# Altium project Audio_Meter_V3.2.PrjPcb (part 6 of 6)
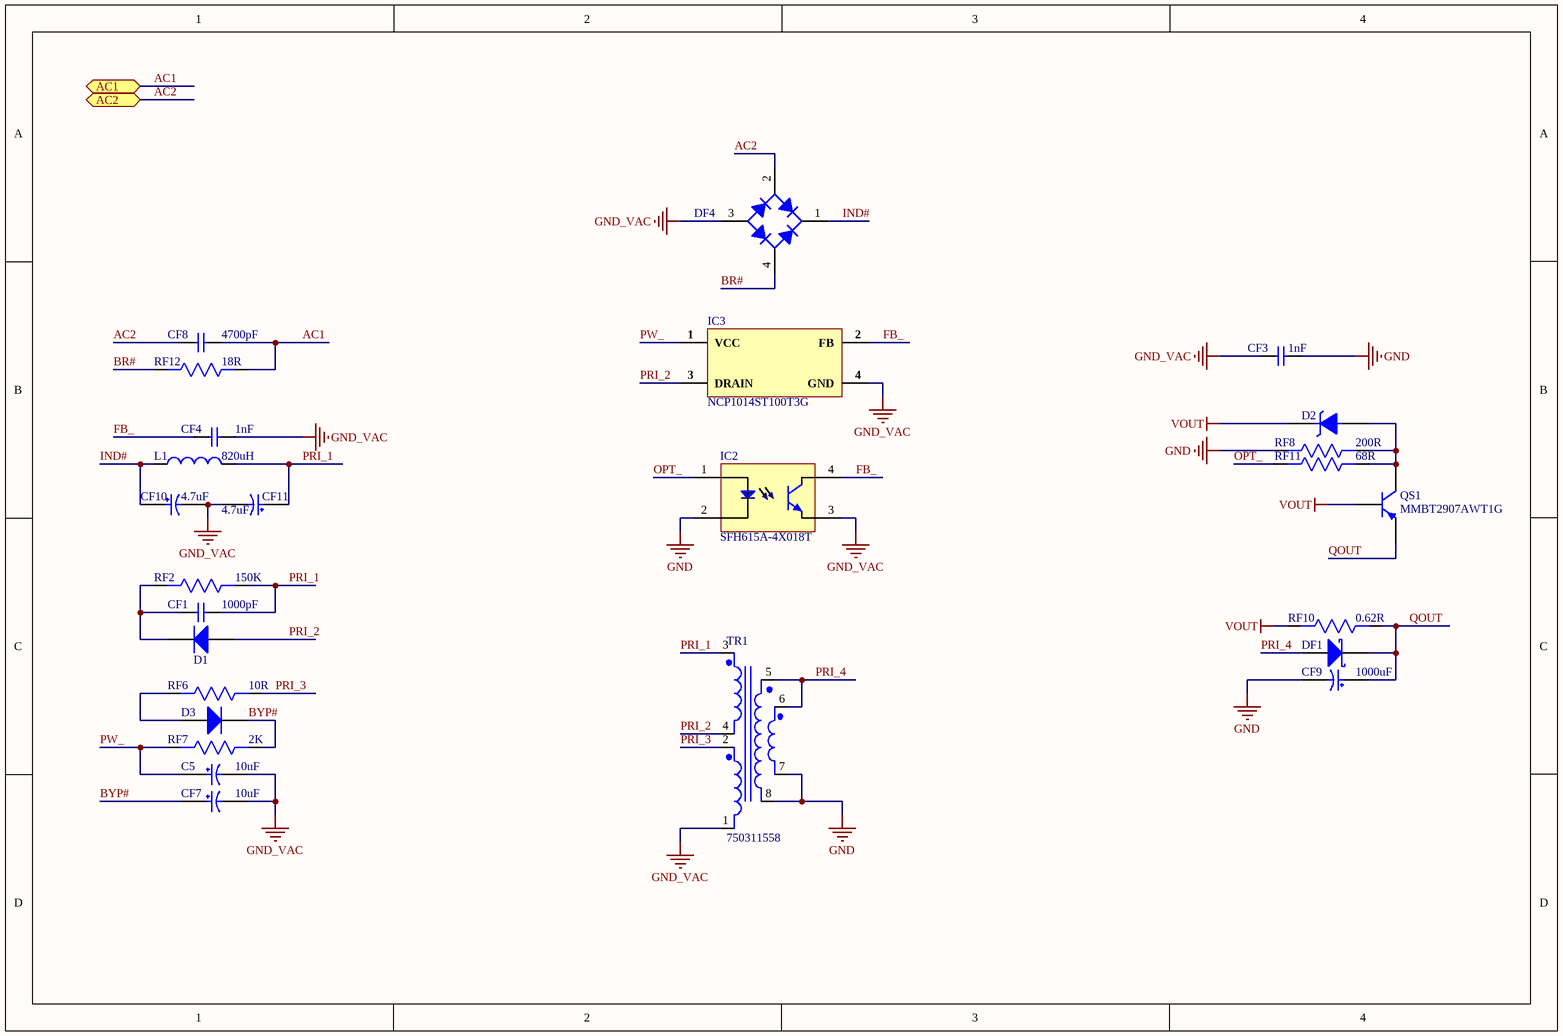
[diagram p9: SMPS_Section.SchDoc]

## Nets that join several sheets
3V3: Controller_Section (7 pins), Audio_Section (9 pins), Connector_Section (J1.1 P4.1), Battery Charging_Section (RC1.2), Power_Section (5 pins), Sensor_Section (C7.1 R4.2 R5.2 U10.5)
BATT_IN: Connector_Section (C24.1 C26.1 J5.1), Battery Charging_Section (C16.1 C17.1 R32.2 U7.2), Power_Section (Q1.3)
GND: Controller_Section (9 pins), Audio_Section (14 pins), Connector_Section (6 pins), Battery Charging_Section (8 pins), Power_Section (8 pins), Sensor_Section (C7.2 U10.2 U10.7), SMPS_Section (6 pins)
VBUS: Controller_Section (R57.1), Connector_Section (P2.1 SB1.1), Battery Charging_Section (C18.1 C19.1 U7.6), Power_Section (D4.A LED2.3 Q1.1 R26.2)
VOUT: Connector_Section (J6.1 P18.1 SB1.2), SMPS_Section (D2.2 QS1.1 RF10.2)
#12-P: Controller_Section (U5.28), Audio_Section (R8.2 U4.1)
#13-P: Controller_Section (U5.30), Audio_Section (R10.2 U4.16)
#14-P: Controller_Section (U5.31), Audio_Section (R12.2 U4.9)
#15-P: Controller_Section (U5.37), Audio_Section (R14.2 U4.8)
#O_MIC: Controller_Section (U5.7), Audio_Section (P9.1 U3.1 U3.4)
AC1: Connector_Section (J7.2), SMPS_Section (CF8.2 RF12.1)
AC2: Connector_Section (J7.1), SMPS_Section (CF8.1 DF4.2)
B_ADC: Controller_Section (U5.8), Battery Charging_Section (P8.1 R32.1 R33.1)
CHG: Controller_Section (U5.13), Battery Charging_Section (RC1.1 U7.3)
DTR: Controller_Section (Q3.2 RC2.1), Connector_Section (J1.5)
IO_4: Controller_Section (Q4.3 R57.2), Power_Section (LED2.2)
RTS: Controller_Section (Q2.2 RC3.1), Connector_Section (J1.4)
RX: Controller_Section (U5.34), Connector_Section (J1.3 P7.1)
SCL_: Controller_Section (U5.36), Sensor_Section (R5.1 U10.6)
SDA_: Controller_Section (U5.33), Sensor_Section (R4.1 U10.1)
TX: Controller_Section (U5.35), Connector_Section (J1.2 P6.1)